# Altium project absenc-27.PrjPcb
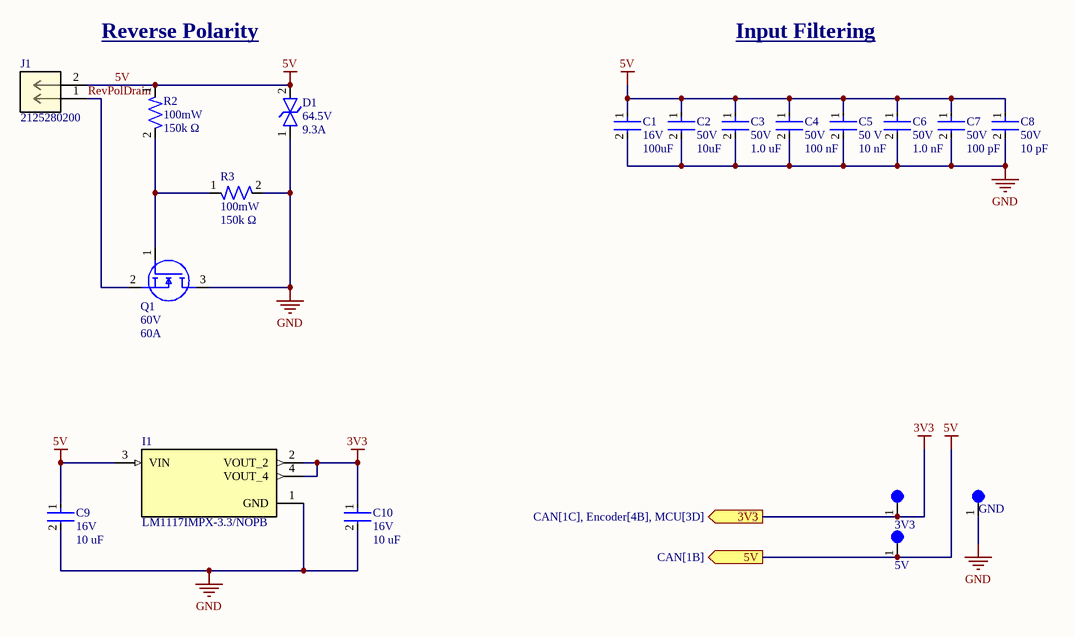
[diagram p0: Input Power.SchDoc]
4 sheets, 57 parts. Net scope: flat (ports and power ports of the same name join across sheets).
Board file: absenc-27.PcbDoc
Sheets:
  Input Power.SchDoc
  MCU.SchDoc
  CAN.SchDoc
  Encoder.SchDoc

## Sheet Input Power.SchDoc
size A; SheetNumber: 1; SheetTotal: 4

### Parts
3V3  5003  [TEST-POINT-0001]  (value not drawn)
5V  5003  [TEST-POINT-0001]  (value not drawn)
C1  Voltage Rating: 16V  Capacitance: 100uF  [CAP-1210]  (hidden comment: CAP 1210)
C2  Voltage Rating: 50V  Capacitance: 10uF  [CAP-0805]  (hidden comment: CAP 0805)
C3  Voltage Rating: 50V  Capacitance: 1.0 uF  [CAP-0603]  (hidden comment: CAP 0603)
C4  Voltage Rating: 50V  Capacitance: 100 nF  [CAP-0603]  (hidden comment: CAP 0603)
C5  Voltage Rating: 50 V  Capacitance: 10 nF  [CAP-0603]  (hidden comment: CAP 0603)
C6  Voltage Rating: 50V  Capacitance: 1.0 nF  [CAP-0603]  (hidden comment: CAP 0603)
C7  Voltage Rating: 50V  Capacitance: 100 pF  [CAP-0603]  (hidden comment: CAP 0603)
C8  Voltage Rating: 50V  Capacitance: 10 pF  [CAP-0603]  (hidden comment: CAP 0603)
C9  Voltage Rating: 16V  Capacitance: 10 uF  [CAP-0603]  (hidden comment: CAP 0603)
C10  Voltage Rating: 16V  Capacitance: 10 uF  [CAP-0603]  (hidden comment: CAP 0603)
D1  Voltage Rating: 64.5V  Current Rating: 9.3A  [DO-214AA (SMBJ)]  (hidden comment: SMBJ40CA)
GND  5003  [TEST-POINT-0001]  (value not drawn)
I1  LM1117IMPX-3.3/NOPB  [IC-SOT-223-4]
J1  2125280200  [CONN_2125280000_02_MOL]
Q1  Voltage: 60V  Continuous Current: 60A  [IC-8VSONCLIP]  (hidden comment: CSD18543Q3AT)
R2  Wattage: 100mW  Resistance: 150k Ω  [RES-0603]  (hidden comment: RES 0603)
R3  Wattage: 100mW  Resistance: 150k Ω  [RES-0603]  (hidden comment: RES 0603)

### Ports
3V3 (out, see CAN[1C], Encoder[4B], MCU[3D]), 5V (out, see CAN[1B])

### Nets
3V3: 3V3.1 C10.1 I1.2(VOUT_2) I1.4(VOUT_4) ; port 3V3
5V: 5V.1 C1.1 C2.1 C3.1 C4.1 C5.1 C6.1 C7.1 C8.1 C9.1 D1.2 I1.3(VIN) J1.2 R2.1 ; port 5V
GND: C1.2 C2.2 C3.2 C4.2 C5.2 C6.2 C7.2 C8.2 C9.2 C10.2 D1.1 GND.1 I1.1(GND) Q1.3(D) R3.2
RevPolDrain: J1.1 Q1.2(S)
NetQ1_1: Q1.1(G) R2.2 R3.1

### Notes on the sheet
- Reverse Polarity
- Input Filtering

### Library data of the parts
3V3 5V GND = TEST-POINT-0001: Oranange PC Test Point, Miniature Phoisphor Bronze Silver Plating Through Hole Mounting Type
D1 = DIO-TVS-0001: TVS DIODE 40VWM 64.5VC DO214AA; ComponentLink1Description: Datasheet; ComponentLink1URL: https://www.littelfuse.com/media?resourcetype=datasheets&itemid=09a6ae9a-73cb-4ac4-acac-e6dab92ab953&filename=littelfuse_tvs_diode_smbj_datasheet.pdf
I1 = IC_LDO_3V3_0001: IC REG LIN 3.3V 800MA SOT223-4; ComponentLink1Description: New link; ComponentLink1URL: https://www.ti.com/lit/ds/symlink/lm1117.pdf?HQS=dis-dk-null-digikeymode-dsf-pf-null-wwe&ts=1721700739746
J1 = CONN MF+ 2 PIN Stacked Right Angle: Micro-Fit+ Right-Angle Header, Through Hole, 3.00mm Pitch, Dual Row, 2 Circuits, 1.52Âµm Matte Tin (Sn) Plating, Glow-Wire Capable, Black; Manufacturer_Name: Molex; Copyright: Copyright (C) 2026 Ultra Librarian. All rights reserved.; Manufacturer_Part_Number: 2125280200; Datasheet: https://www.molex.com/en-us/products/part-detail-pdf/2125280200?display=pdf; RefDes: RefDes; Type: Type
Q1 = NMOS-60A-0001: MOSFET N-CH 60V 12A/60A 8VSON; ComponentLink2Description: Datasheet; ComponentLink2URL: http://www.ti.com/lit/ds/symlink/csd18543q3a.pdf

## Sheet MCU.SchDoc
size A; SheetNumber: 2; SheetTotal: 4
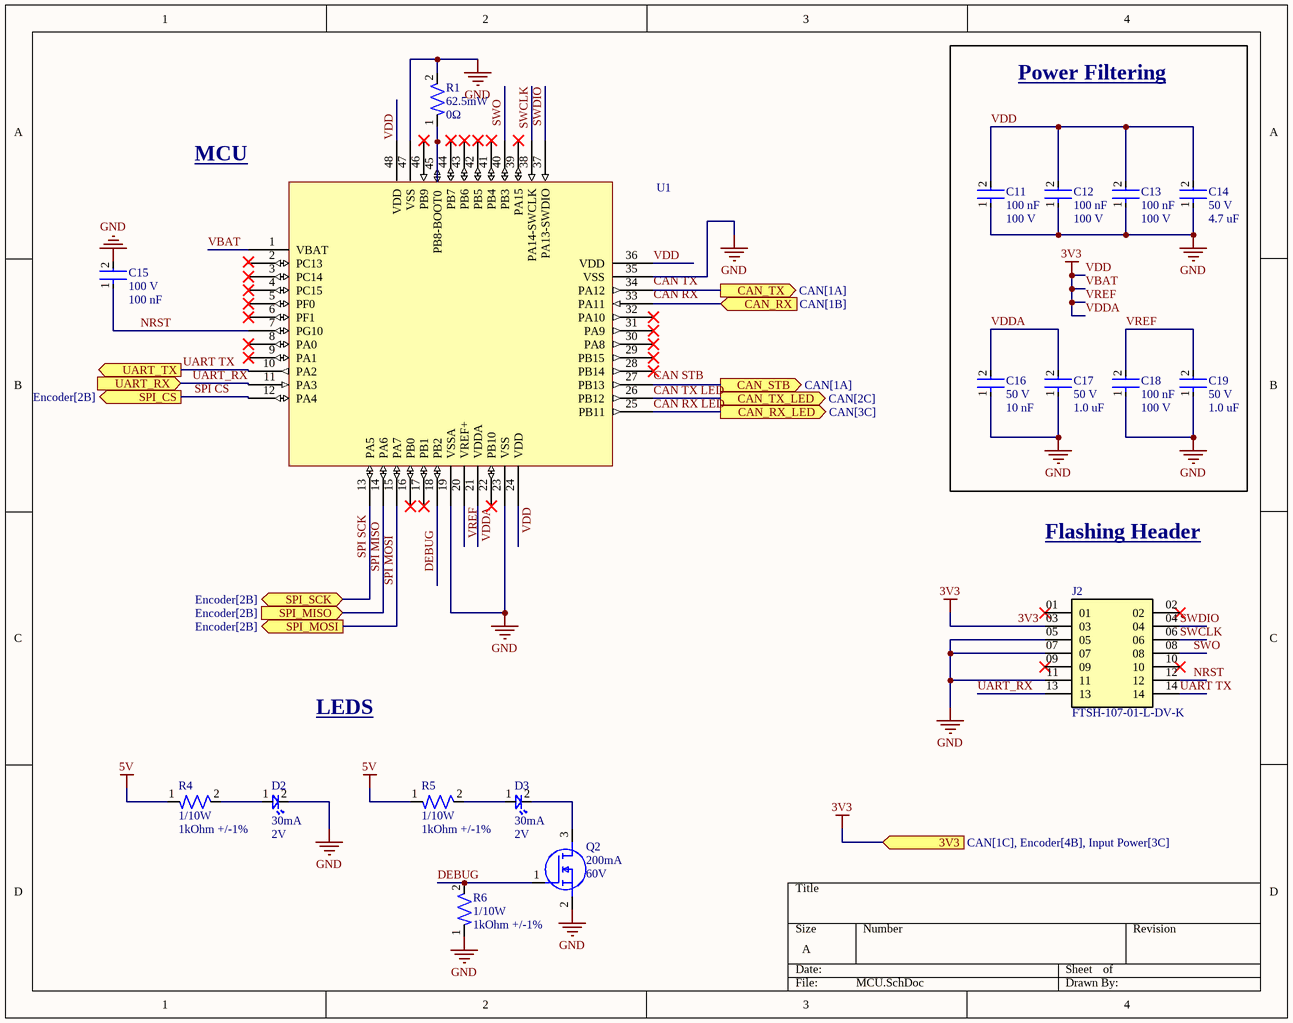
[diagram p1: MCU.SchDoc]

### Parts
C11  Capacitance: 100 nF  Voltage: 100 V  [CAP-0603]  (hidden comment: CC0603KRX7R0BB104)
C12  Capacitance: 100 nF  Voltage: 100 V  [CAP-0603]  (hidden comment: CC0603KRX7R0BB104)
C13  Capacitance: 100 nF  Voltage: 100 V  [CAP-0603]  (hidden comment: CC0603KRX7R0BB104)
C14  Voltage Rating: 50 V  Capacitance: 4.7 uF  [CAP-0805]  (hidden comment: CAP 0805)
C15  Voltage Rating: 100 V  Capacitance: 100 nF  [CAP-0603]  (hidden comment: CAP 0603)
C16  Voltage Rating: 50 V  Capacitance: 10 nF  [CAP-0603]  (hidden comment: CAP 0603)
C17  Voltage Rating: 50 V  Capacitance: 1.0 uF  [CAP-0603]  (hidden comment: CAP 0603)
C18  Capacitance: 100 nF  Voltage: 100 V  [CAP-0603]  (hidden comment: CC0603KRX7R0BB104)
C19  Voltage Rating: 50 V  Capacitance: 1.0 uF  [CAP-0603]  (hidden comment: CAP 0603)
D2  Forward Current: 30mA  Forward Voltage: 2V  [LED-0603]  (hidden comment: BL-HKC36G-AV-TRB)
D3  Forward Current: 30mA  Forward Voltage: 2V  [LED-0603]  (hidden comment: BL-HKC36G-AV-TRB)
J2  FTSH-107-01-L-DV-K  [SAMTEC_FTSH-107-01-L-DV-K]
Q2  Continuous Current: 200mA  Voltage: 60V  [IC-SOT23-3]  (hidden comment: T2N7002AK,LM)
R1  Wattage: 62.5mW  Resistance: 0Ω  [RES-0402]  (hidden comment: RES 0402)
R4  Wattage: 1/10W  Resistance: 1kOhm +/-1%  [RES-0603]  (hidden comment: RES 0603)
R5  Wattage: 1/10W  Resistance: 1kOhm +/-1%  [RES-0603]  (hidden comment: RES 0603)
R6  Wattage: 1/10W  Resistance: 1kOhm +/-1%  [RES-0603]  (hidden comment: RES 0603)
U1  STM32G431CBT6  [IC-LQFP48]  (value not drawn)

### Blocks framed on the sheet
Power Filtering: C11-C14 C16-C19

### Ports
3V3 (in, see CAN[1C], Encoder[4B], Input Power[3C]), CAN_RX (in, see CAN[1B]), CAN_RX_LED (out, see CAN[3C]), CAN_STB (out, see CAN[1A]), CAN_TX (out, see CAN[1A]), CAN_TX_LED (out, see CAN[2C]), SPI_CS (out, see Encoder[2B]), SPI_MISO (in, see Encoder[2B]), SPI_MOSI (out, see Encoder[2B]), SPI_SCK (bidir, see Encoder[2B]), UART_RX (in), UART_TX (out)

### Nets
3V3: C11.2 C12.2 C13.2 C14.2 C16.2 C17.2 C18.2 C19.2 J2.03 U1.1(VBAT) U1.20(VREF+) U1.21(VDDA) U1.24(VDD) U1.36(VDD) U1.48(VDD) ; port 3V3  [also labelled VBAT, VDD, VDDA, VREF]
5V: R4.1 R5.1
GND: C11.1 C12.1 C13.1 C14.1 C15.2 C16.1 C17.1 C18.1 C19.1 D2.2 J2.05 J2.07 J2.11 Q2.2(S) R1.2 R6.1 U1.19(VSSA) U1.23(VSS) U1.35(VSS) U1.47(VSS)
CAN RX LED: U1.25(PB11) ; port CAN_RX_LED
CAN TX LED: U1.26(PB12) ; port CAN_TX_LED
CAN_RX: U1.33(PA11) ; port CAN_RX
CAN_STB: U1.27(PB13) ; port CAN_STB
CAN_TX: U1.34(PA12) ; port CAN_TX
DEBUG: Q2.1(G) R6.2 U1.18(PB2)
NRST: C15.1 J2.12 U1.7(PG10)
SPI CS: U1.12(PA4) ; port SPI_CS
SPI MISO: U1.14(PA6) ; port SPI_MISO
SPI MOSI: U1.15(PA7) ; port SPI_MOSI
SPI SCK: U1.13(PA5) ; port SPI_SCK
SWCLK: J2.06 U1.38(PA14-SWCLK)
SWDIO: J2.04 U1.37(PA13-SWDIO)
SWO: J2.08 U1.40(PB3)
UART TX: J2.14 U1.10(PA2) ; port UART_TX
UART_RX: J2.13 U1.11(PA3) ; port UART_RX
NetD2_1: D2.1 R4.2
NetD3_1: D3.1 R5.2
NetD3_2: D3.2 Q2.3(D)
NetR1_1: R1.1 U1.45(PB8-BOOT0)

Not connected (* = marked no-connect by the designer): J2 01* 02* 09* 10*; U1 2(PC13) 3(PC14)* 4(PC15)* 5(PF0)* 6(PF1)* 8(PA0)* 9(PA1)* 16(PB0)* 17(PB1)* 22(PB10)* 28(PB14)* 29(PB15)* 30(PA8)* 31(PA9)* 32(PA10)* 39(PA15)* 41(PB4)* 42(PB5)* 43(PB6)* 44(PB7)* 46(PB9)*

### Notes on the sheet
- MCU
- Flashing Header
- LEDS
- Labels drawn without touching a wire or pin: CAN RX, CAN STB, CAN TX

### Library data of the parts
C11-C13 C18 = CAP-100N-0001: CAP CER 0.1UF 100V X7R 0603; Device Class: Ceramic; Size: 0603; ComponentLink1Description: Datasheet; ComponentLink1URL: https://www.yageo.com/upload/media/product/app/datasheet/mlcc/upy-np0x7r_mv_100-to-630v.pdf
D2 D3 = LED-0001: LED YELLOW CLEAR 0603 SMD; ComponentLink1Description: Datasheet; ComponentLink1URL: https://www.americanbrightled.com/pdffiles/led-components/smt/BL-HKC36G-AV-TRB.pdf
J2 = CONN_Flashing-0001: Connector Header Surface Mount 14 position 0.050" (1.27mm); MF: Samtec; Value: *; Price: None; Package: None; Availability: Unavailable; MP: FTSH-107-01-L-DV-K; ComponentLink1Description: Datasheet; ComponentLink1URL: https://mm.digikey.com/Volume0/opasdata/d220001/medias/docus/6209/ftsh-1xx-xx-xxx-dv-xxx-xxx-x-xx-mkt.pdf
Q2 = NMOS-200MA-0001: MOSFET N-CH 60V 200MA SOT23; ComponentLink1Description: Datasheet; ComponentLink1URL: https://toshiba.semicon-storage.com/info/T2N7002AK_datasheet_en_20150401.pdf?did=29712&prodName=T2N7002AK
U1 = IC-STM32G431CBT6: IC MCU 32BIT 128KB FLASH 48LQFP; Package: 48LQFP; ComponentLink1Description: Datasheet; ComponentLink1URL: https://www.st.com/resource/en/datasheet/stm32g431cb.pdf

## Sheet CAN.SchDoc
size A; SheetNumber: 3; SheetTotal: 4
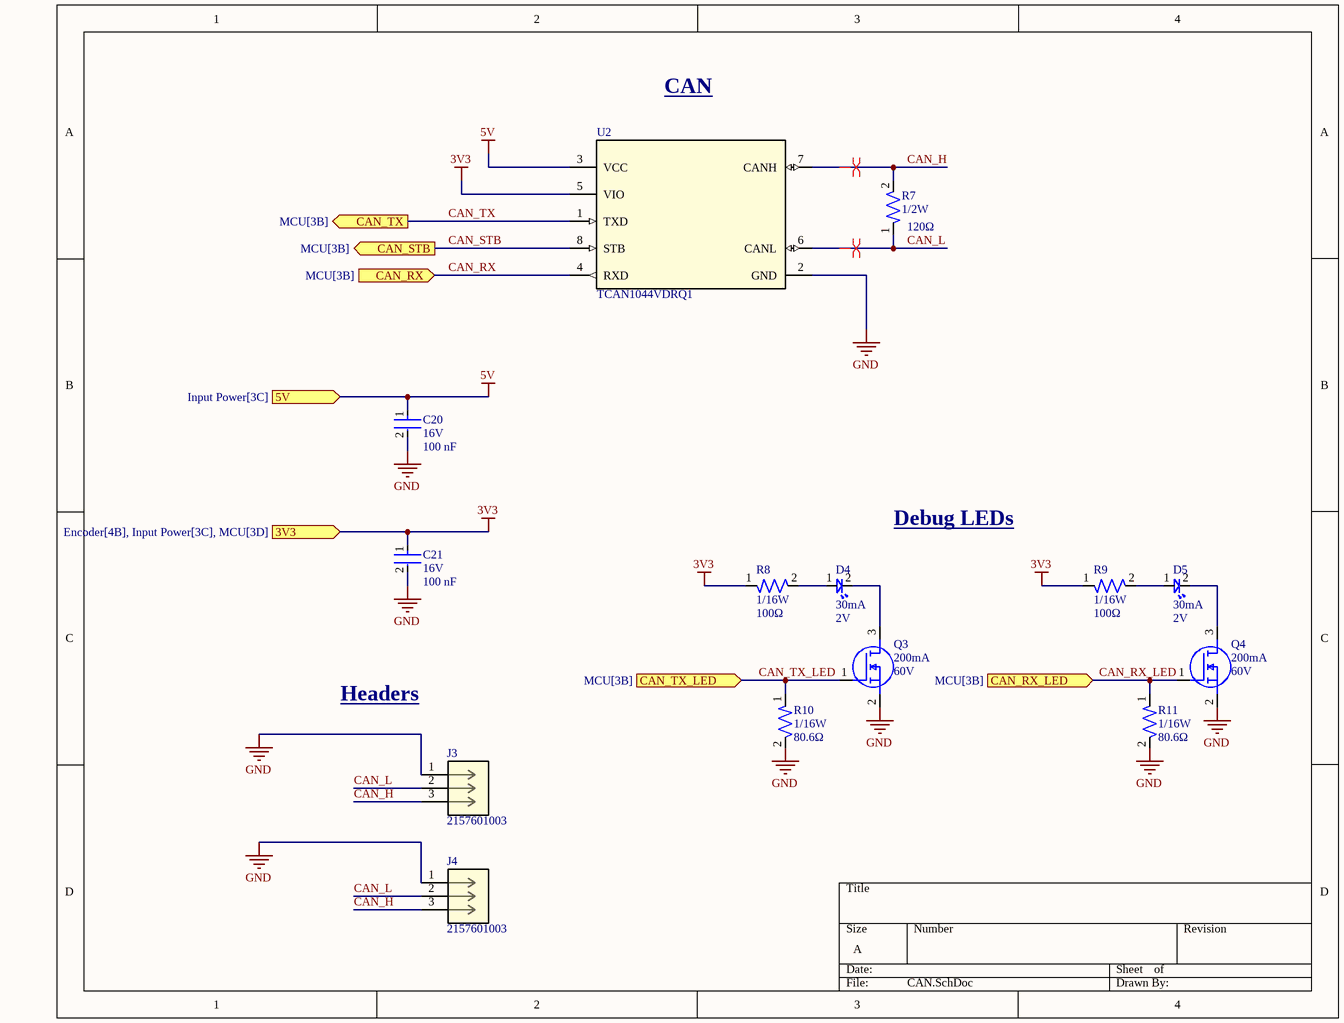
[diagram p2: CAN.SchDoc]

### Parts
C20  Voltage Rating: 16V  Capacitance: 100 nF  [CAP-0603]  (hidden comment: CAP 0603)
C21  Voltage Rating: 16V  Capacitance: 100 nF  [CAP-0603]  (hidden comment: CAP 0603)
D4  Forward Current: 30mA  Forward Voltage: 2V  [LED-0603]  (hidden comment: BL-HKC36G-AV-TRB)
D5  Forward Current: 30mA  Forward Voltage: 2V  [LED-0603]  (hidden comment: BL-HKC36G-AV-TRB)
J3  2157601003  [CONN_2157600003-SD_03_PEG_MOL]
J4  2157601003  [CONN_2157600003-SD_03_PEG_MOL]
Q3  Continuous Current: 200mA  Voltage: 60V  [IC-SOT23-3]  (hidden comment: T2N7002AK,LM)
Q4  Continuous Current: 200mA  Voltage: 60V  [IC-SOT23-3]  (hidden comment: T2N7002AK,LM)
R7  Wattage: 1/2W  Resistance: 120Ω  [RES-0603]  (hidden comment: RES 0603)
R8  Wattage: 1/16W  Resistance: 100Ω  [RES-0603]  (hidden comment: RES 0603)
R9  Wattage: 1/16W  Resistance: 100Ω  [RES-0603]  (hidden comment: RES 0603)
R10  Wattage: 1/16W  Resistance: 80.6Ω  [RES-0603]  (hidden comment: RES 0603)
R11  Wattage: 1/16W  Resistance: 80.6Ω  [RES-0603]  (hidden comment: RES 0603)
U2  TCAN1044VDRQ1  [IC-8SOIC]

### Ports
3V3 (in, see Encoder[4B], Input Power[3C], MCU[3D]), 5V (in, see Input Power[3C]), CAN_RX (in, see MCU[3B]), CAN_RX_LED (in, see MCU[3B]), CAN_STB (out, see MCU[3B]), CAN_TX (out, see MCU[3B]), CAN_TX_LED (in, see MCU[3B])

### Nets
3V3: C21.1 R8.1 R9.1 U2.5(VIO) ; port 3V3
5V: C20.1 U2.3(VCC) ; port 5V
GND: C20.2 C21.2 J3.1 J4.1 Q3.2(S) Q4.2(S) R10.2 R11.2 U2.2(GND)
CAN_H: J3.3 J4.3 R7.2 U2.7(CANH)
CAN_L: J3.2 J4.2 R7.1 U2.6(CANL)
CAN_RX: U2.4(RXD) ; port CAN_RX
CAN_RX_LED: Q4.1(G) R11.1 ; port CAN_RX_LED  [project net CAN RX LED]
CAN_STB: U2.8(STB) ; port CAN_STB
CAN_TX: U2.1(TXD) ; port CAN_TX
CAN_TX_LED: Q3.1(G) R10.1 ; port CAN_TX_LED  [project net CAN TX LED]
NetD4_1: D4.1 R8.2
NetD4_2: D4.2 Q3.3(D)
NetD5_1: D5.1 R9.2
NetD5_2: D5.2 Q4.3(D)

### Layout directives
differential pair: CAN_H, CAN_L

### Notes on the sheet
- CAN
- Debug LEDs
- Headers

### Library data of the parts
D4 D5 = LED-0001: LED YELLOW CLEAR 0603 SMD; ComponentLink1Description: Datasheet; ComponentLink1URL: https://www.americanbrightled.com/pdffiles/led-components/smt/BL-HKC36G-AV-TRB.pdf
J3 J4 = CONN MF+ 3 PIN Right Angle: Micro-Fit+ Right-Angle Header, Through Hole, 3.00mm Pitch, Single Row, 3  Circuits, Matte Tin (Sn) Plating, Glow-Wire Capable, Black; Manufacturer_Name: Molex; Copyright: Copyright (C) 2026 Ultra Librarian. All rights reserved.; Manufacturer_Part_Number: 2157601003; Datasheet: https://www.molex.com/en-us/products/part-detail-pdf/2157601003?display=pdf; RefDes: RefDes; Type: Type
Q3 Q4 = NMOS-200MA-0001: MOSFET N-CH 60V 200MA SOT23; ComponentLink1Description: Datasheet; ComponentLink1URL: https://toshiba.semicon-storage.com/info/T2N7002AK_datasheet_en_20150401.pdf?did=29712&prodName=T2N7002AK
U2 = IC-CAN-0001: IC TRANSCEIVER 1/1 8SOIC; ComponentLink1Description: Datasheet; ComponentLink1URL: https://www.ti.com/lit/ds/symlink/tcan1044-q1.pdf?HQS=dis-dk-null-digikeymode-dsf-pf-null-wwe&ts=1728758303289&ref_url=https%253A%252F%252Fwww.ti.com%252Fgeneral%252Fdocs%252Fsuppproductinfo.tsp%253FdistId%253D10%2526gotoUrl%253Dhttps%253A%252F%252Fwww.ti.com%252Flit%252Fgpn%252Ftcan1044-q1

## Sheet Encoder.SchDoc
size A; SheetNumber: 4; SheetTotal: 4
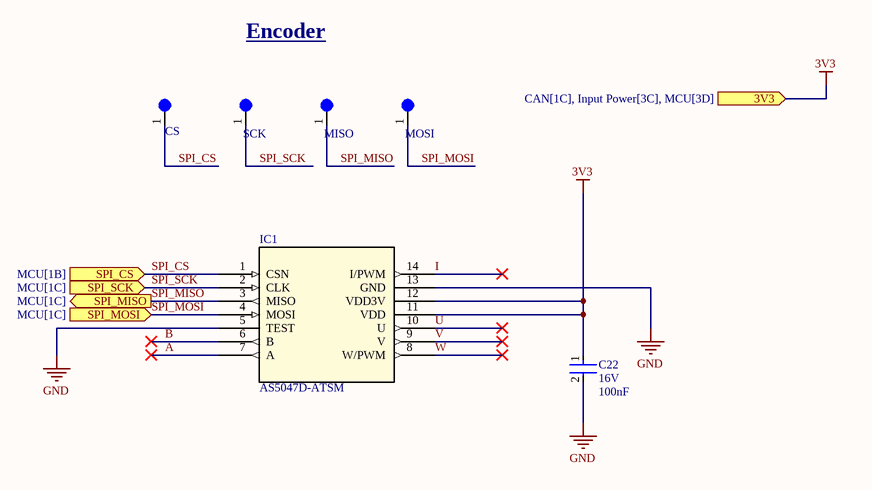
[diagram p3: Encoder.SchDoc]

### Parts
C22  Voltage Rating: 16V  Capacitance: 100nF  [CAP-0603]  (hidden comment: CAP 0603)
CS  5003  [TEST-POINT-0001]  (value not drawn)
IC1  AS5047D-ATSM  [TSSOP14_AMS]
MISO  5003  [TEST-POINT-0001]  (value not drawn)
MOSI  5003  [TEST-POINT-0001]  (value not drawn)
SCK  5003  [TEST-POINT-0001]  (value not drawn)

### Ports
3V3 (in, see CAN[1C], Input Power[3C], MCU[3D]), SPI_CS (in, see MCU[1B]), SPI_MISO (out, see MCU[1C]), SPI_MOSI (in, see MCU[1C]), SPI_SCK (in, see MCU[1C])

### Nets
3V3: C22.1 IC1.11(VDD) IC1.12(VDD3V) ; port 3V3
GND: C22.2 IC1.5(TEST) IC1.13(GND)
A: IC1.7(A)
B: IC1.6(B)
I: IC1.14(I/PWM)
SPI_CS: CS.1 IC1.1(CSN) ; port SPI_CS  [project net SPI CS]
SPI_MISO: IC1.3(MISO) MISO.1 ; port SPI_MISO  [project net SPI MISO]
SPI_MOSI: IC1.4(MOSI) MOSI.1 ; port SPI_MOSI  [project net SPI MOSI]
SPI_SCK: IC1.2(CLK) SCK.1 ; port SPI_SCK  [project net SPI SCK]
U: IC1.10(U)
V: IC1.9(V)
W: IC1.8(W/PWM)

### Notes on the sheet
- Encoder

### Library data of the parts
CS MISO MOSI SCK = TEST-POINT-0001: as 3V3 on sheet Input Power
IC1 = AS5047D-ATSM: Description; Manufacturer_Name: ams OSRAM; Copyright: Copyright (C) 2026 Ultra Librarian. All rights reserved.; Manufacturer_Part_Number: AS5047D-ATSM; RefDes: RefDes; Type: Type

## Nets that join several sheets
3V3: Input Power (3V3.1 C10.1 I1.2 I1.4), MCU (15 pins), CAN (C21.1 R8.1 R9.1 U2.5), Encoder (C22.1 IC1.11 IC1.12)
5V: Input Power (14 pins), MCU (R4.1 R5.1), CAN (C20.1 U2.3)
GND: Input Power (15 pins), MCU (20 pins), CAN (9 pins), Encoder (C22.2 IC1.5 IC1.13)
CAN RX LED: MCU (U1.25), CAN (Q4.1 R11.1)
CAN TX LED: MCU (U1.26), CAN (Q3.1 R10.1)
CAN_RX: MCU (U1.33), CAN (U2.4)
CAN_STB: MCU (U1.27), CAN (U2.8)
CAN_TX: MCU (U1.34), CAN (U2.1)
SPI CS: MCU (U1.12), Encoder (CS.1 IC1.1)
SPI MISO: MCU (U1.14), Encoder (IC1.3 MISO.1)
SPI MOSI: MCU (U1.15), Encoder (IC1.4 MOSI.1)
SPI SCK: MCU (U1.13), Encoder (IC1.2 SCK.1)